# Altium schematic sheet Detect_220.SchDoc
size C; SheetNumber: 7; SheetTotal: 9
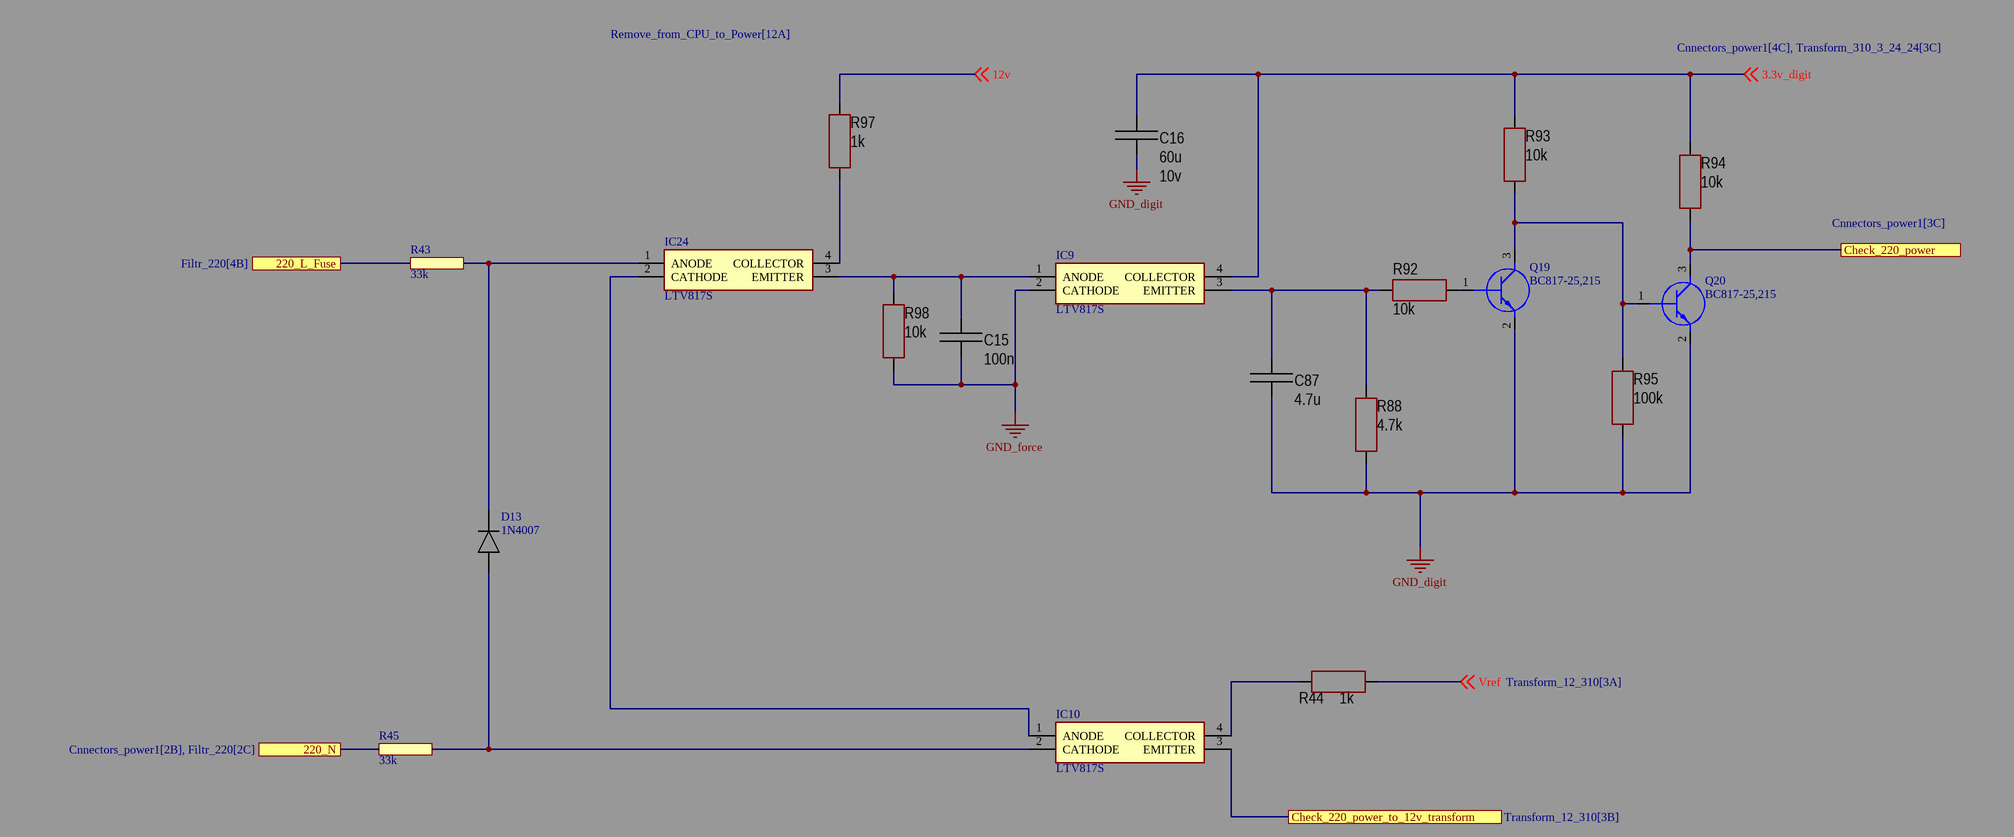
[diagram p0: Detect_220.SchDoc]

## Parts
C15  value 100n  [CAP: 1206]
C16  value 60u  Voltage: 10v  [CAP: 1206]
C87  value 4.7u  [CAP: 1206]
D13  1N4007  [THT_D_6mm_1]
IC9  LTV817S  [SOP254P1016X460-4N]
IC10  LTV817S  [SOP254P1016X460-4N]
IC24  LTV817S  [SOP254P1016X460-4N]
Q19  BC817-25,215  [BC81725215]
Q20  BC817-25,215  [BC81725215]
R43  33k  [THT_R_6mm_1]
R44  value 1k  [RES: 1206]
R45  33k  [THT_R_6mm_1]
R88  value 4.7k  [RES: 1206]
R92  value 10k  [RES: 1206]
R93  value 10k  [RES: 1206]
R94  value 10k  [RES: 1206]
R95  value 100k  [RES: 1206]
R97  value 1k  [RES: 1206]
R98  value 10k  [RES: 1206]

## Ports
220_L_Fuse (see Filtr_220[4B]), 220_N (see Cnnectors_power1[2B], Filtr_220[2C]), Check_220_power (see Cnnectors_power1[3C]), Check_220_power_to_12v_transform (see Transform_12_310[3B])

## Nets
GND_digit: C16.1 C87.1 Q19.2(E) Q20.2(E) R88.1 R95.1
GND_force: C15.1 IC9.2(CATHODE) R98.2
3.3v_digit: C16.2 IC9.4(COLLECTOR) R93.2 R94.2 ; off-sheet 3.3v_digit
12v: R97.2 ; off-sheet 12v
220_L_Fuse: R43.1 ; port 220_L_Fuse
220_N: R45.1 ; port 220_N
Check_220_power: Q20.3(C) R94.1 ; port Check_220_power
Check_220_power_to_12v_transform: IC10.3(EMITTER) ; port Check_220_power_to_12v_transform
Vref: R44.2 ; off-sheet Vref
NetC15_2: C15.2 IC9.1(ANODE) IC24.3(EMITTER) R98.1
NetC87_2: C87.2 IC9.3(EMITTER) R88.2 R92.2
NetD13_1: D13.1 IC10.2(CATHODE) R45.2
NetD13_2: D13.2 IC24.1(ANODE) R43.2
NetIC10_1: IC10.1(ANODE) IC24.2(CATHODE)
NetIC10_4: IC10.4(COLLECTOR) R44.1
NetIC24_4: IC24.4(COLLECTOR) R97.1
NetQ19_1: Q19.1(B) R92.1
NetQ19_3: Q19.3(C) Q20.1(B) R93.1 R95.2

## Library data of the parts
C15 = Ceramic_1206: Manufacturer: Yageo; PartNumber: CC1206KRX7R9BB104; ValueManufacturerPartNumber: Ceramic capacitor, 100n, X7R, ±10%, 50V, 1206, -55...+125°C; TypeCapacitor: Ceramic capacitor; Tolerance: ±10%; TypeDielectric: X7R; Voltage: 50V; Package: 1206; HelpURL: https://www.digikey.com/product-detail/en/yageo/CC1206KRX7R9BB104/311-1179-1-ND/303089; Temperature: -55...+125°C
C16 = Ceramic_1206: Manufacturer: Yageo; PartNumber: CC1206KRX7R9BB104; ValueManufacturerPartNumber: Ceramic capacitor, 60u, X7R, ±10%, 10v, 1206, -55...+125°C; TypeCapacitor: Ceramic capacitor; Tolerance: ±10%; TypeDielectric: X7R; Package: 1206; HelpURL: https://www.digikey.com/product-detail/en/yageo/CC1206KRX7R9BB104/311-1179-1-ND/303089; Temperature: -55...+125°C
C87 = Ceramic_1206: Manufacturer: Yageo; PartNumber: CC1206KRX7R9BB104; ValueManufacturerPartNumber: Ceramic capacitor, 4.7u, X7R, ±10%, 50V, 1206, -55...+125°C; TypeCapacitor: Ceramic capacitor; Tolerance: ±10%; TypeDielectric: X7R; Voltage: 50V; Package: 1206; HelpURL: https://www.digikey.com/product-detail/en/yageo/CC1206KRX7R9BB104/311-1179-1-ND/303089; Temperature: -55...+125°C
D13 = THT_D_6mm_1
IC9 IC10 IC24 = LTV817S: Integrated Circuit; Manufacturer_Name: Lite-On; Datasheet Link: https://www.arrow.com/en/products/ltv-817s/lite-on-technology; Height: 4.6mm; Manufacturer_Part_Number: LTV817S; Arrow Part Number: LTV817S; Arrow Price/Stock: https://www.arrow.com/en/products/ltv-817s/lite-on-technology
Q19 Q20 = BC817-25,215_1: Transistor BJT NPN; Manufacturer_Name: Nexperia; Datasheet Link: https://assets.nexperia.com/documents/data-sheet/BC817_SER.pdf; Height: 1.1mm; Manufacturer_Part_Number: BC817-25,215; Mouser Part Number: 771-BC817-25-T/R; Mouser Price/Stock: https://www.mouser.co.uk/ProductDetail/Nexperia/BC817-25215?qs=me8TqzrmIYUj67JkTBzlfg%3D%3D; Arrow Part Number: BC817-25,215; Arrow Price/Stock: https://www.arrow.com/en/products/bc817-25215/nexperia?region=nac
R43 R45 = THT_R_6mm_1
R44 R97 = Resistor_1206: Manufacturer: Yageo; PartNumber: RC1206JR-07100RL; ValueManufacturerPartNumber: Resistor film, 1k, ±5%, 1206, 0.25W, -55...+125°C; TypeResistor: Resistor film; Power: 0.25W; Tolerance: ±5%; Package: 1206; HelpURL: https://www.digikey.com/product-detail/en/yageo/RC1206JR-07100RL/311-100ERCT-ND/732153; Temperature: -55...+125°C
  R44: Parameter 1: *
R88 = Resistor_1206: Manufacturer: Yageo; PartNumber: RC1206JR-07100RL; ValueManufacturerPartNumber: Resistor film, 4.7k, ±5%, 1206, 0.25W, -55...+125°C; TypeResistor: Resistor film; Power: 0.25W; Tolerance: ±5%; Package: 1206; HelpURL: https://www.digikey.com/product-detail/en/yageo/RC1206JR-07100RL/311-100ERCT-ND/732153; Temperature: -55...+125°C
R92-R94 R98 = Resistor_1206: Manufacturer: Yageo; PartNumber: RC1206JR-07100RL; ValueManufacturerPartNumber: Resistor film, 10k, ±5%, 1206, 0.25W, -55...+125°C; TypeResistor: Resistor film; Power: 0.25W; Tolerance: ±5%; Package: 1206; HelpURL: https://www.digikey.com/product-detail/en/yageo/RC1206JR-07100RL/311-100ERCT-ND/732153; Temperature: -55...+125°C
R95 = Resistor_1206: Manufacturer: Yageo; PartNumber: RC1206JR-07100RL; ValueManufacturerPartNumber: Resistor film, 100k, ±5%, 1206, 0.25W, -55...+125°C; TypeResistor: Resistor film; Power: 0.25W; Tolerance: ±5%; Package: 1206; HelpURL: https://www.digikey.com/product-detail/en/yageo/RC1206JR-07100RL/311-100ERCT-ND/732153; Temperature: -55...+125°C